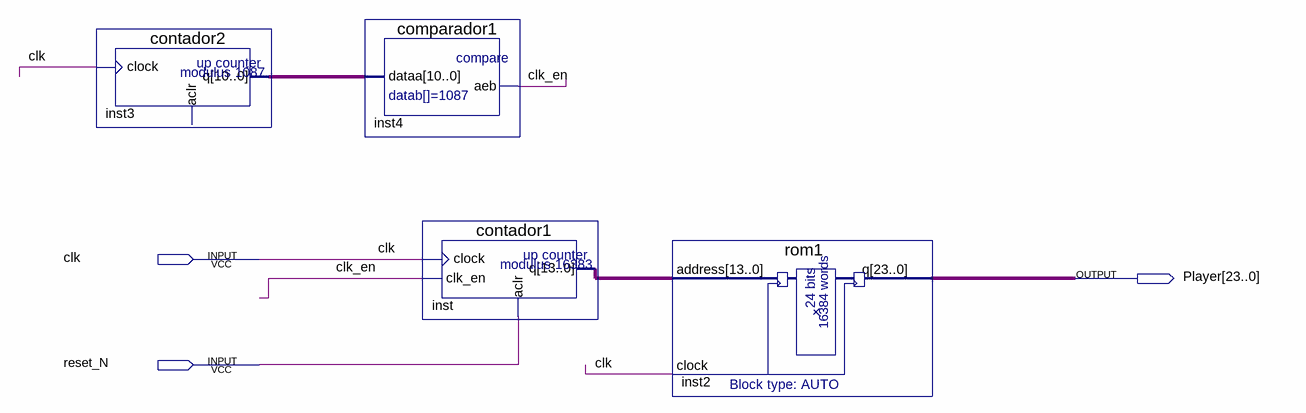
[diagram p0: schematic sheet]
// Quartus schematic Audio_Player.bdf as structural Verilog: 4 symbols, 3 pins
module Audio_Player (
  input  clk,
  input  reset_N,
  output [23:0] Player
);

  wire clk_en;
  wire [10:0] inst3_q;
  wire [13:0] inst_q;

  contador2 inst3 (.clock(clk), .q(inst3_q));  // open: aclr
  comparador1 inst4 (.dataa(inst3_q), .aeb(clk_en));
  contador1 inst (.clock(clk), .clk_en(clk_en), .aclr(reset_N), .q(inst_q));
  rom1 inst2 (.address(inst_q), .clock(clk), .q(Player));
endmodule
